# Altium schematic sheet signal-light-6.SchDoc
size A4; SheetNumber: 9; SheetTotal: 21
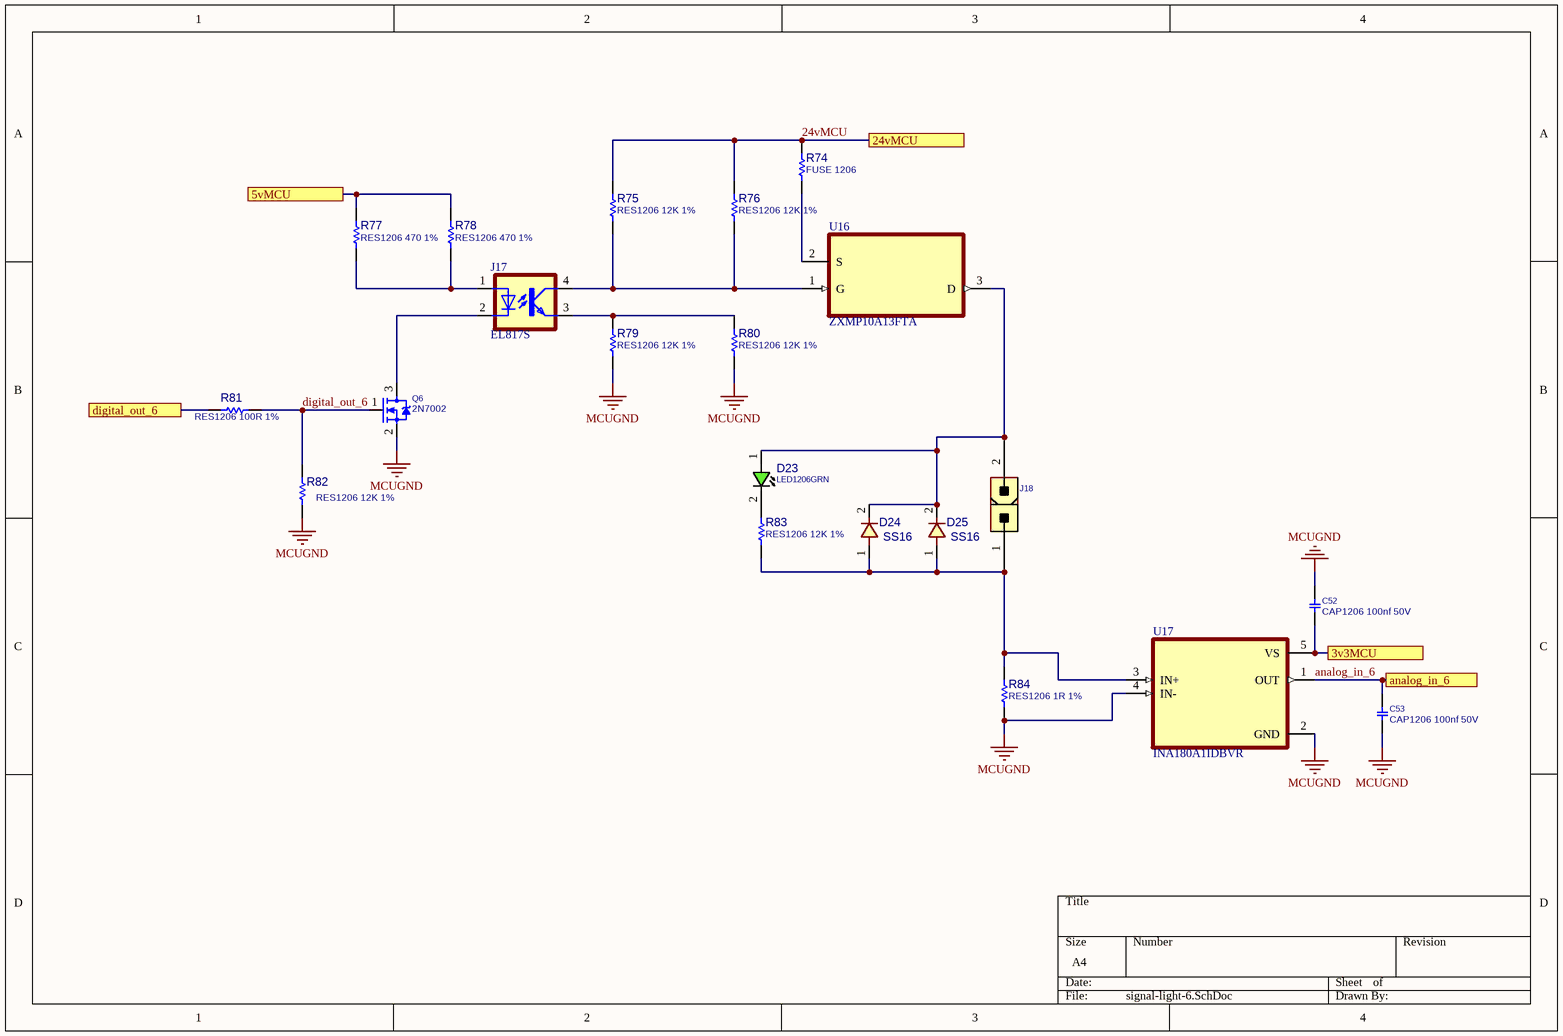
[diagram p0: signal-light-6.SchDoc]

## Parts
C52  CAP1206 100nf 50V  [C1206]
C53  CAP1206 100nf 50V  [C1206]
D23  LED1206GRN  [LED1206GRN]
D24  SS16  [D_SMA]
D25  SS16  [D_SMA]
J17  EL817S  [SOIC254P1030X460-4N]
J18  CONN_ATXPWR_2  [ATXPWR_2]  (value not drawn)
Q6  2N7002  [SOT23_3]
R74  FUSE 1206  [R1206]
R75  RES1206 12K 1%  [R1206]
R76  RES1206 12K 1%  [R1206]
R77  RES1206 470 1%  [R1206]
R78  RES1206 470 1%  [R1206]
R79  RES1206 12K 1%  [R1206]
R80  RES1206 12K 1%  [R1206]
R81  RES1206 100R 1%  [R1206]
R82  RES1206 12K 1%  [R1206]
R83  RES1206 12K 1%  [R1206]
R84  RES1206 1R 1%  [R1206]
U16  ZXMP10A13FTA  [SOT95P230X110-3N]
U17  INA180A1IDBVR  [SOT95P280X145-5N]

## Ports
3v3MCU, 5vMCU, 24vMCU, analog_in_6, digital_out_6

## Nets
MCUGND: C52.1 C53.2 Q6.2(SOURCE) R79.2 R80.2 R82.2 R84.2 U17.2(GND) U17.4(IN-)
3v3MCU: C52.2 U17.5(VS) ; port 3v3MCU
5vMCU: R77.2 R78.2 ; port 5vMCU
24vMCU: R74.1 R75.1 R76.1 ; port 24vMCU
analog_in_6: C53.1 U17.1(OUT) ; port analog_in_6
digital_out_6: Q6.1(GATE) R81.2 R82.1
digital_out_6: R81.1 ; port digital_out_6  [a separate net that carries the same name]
NetD23_1: D23.1(ANODE) D24.2 D25.2 J18.2 U16.3(D)
NetD23_2: D23.2(CATHODE) R83.1
NetD24_1: D24.1 D25.1 J18.1 R83.2 R84.1 U17.3(IN+)
NetJ17_1: J17.1(A) R77.1 R78.1
NetJ17_2: J17.2(C) Q6.3(DRAIN)
NetJ17_3: J17.3(EMIT) R79.1 R80.1
NetJ17_4: J17.4(COL) R75.2 R76.2 U16.1(G)
NetR74_2: R74.2 U16.2(S)

## Library data of the parts
C52 C53 = CAP_SMD_MLCC_1206: CAP, MLCC; PARAM: -, -%; MANF_P#: MANF_PART#; PARAM2: -V; PRICE: 100= 1$; MANF: -; ASSEMBLY: ASSEMBLY
D23 = LED_SMD_1206_GRN: LED, SMD, 1206, GREEN; PARAM: 20mA; DESC: DESCRIPTION; PARAM2: 2.2V; MANF: -; ASSEMBLY: ASSEMBLY; PRICE: 36t@Javan; MANF_P#: -; VALUE: LED1206GRN; MountType: SMT; PartType: LED
D24 D25 = DIODE_SMD_1N4001: DIODE, GENERAL PURPOSE, 50V/1A; DESC: DESCRIPTION; PARAM: 50V VRRM; PARAM2: 1A; MANF_P#: 1N4001; MANF: MANF; ASSEMBLY: ASSEMBLY; PRICE: PRICE; VALUE: SS16
J17 = EL817S: Optoisolator Transistor Output 5000Vrms 1 Channel 4-SMD; MF: Everlight Electronics; SnapEDA_Link: https://www.snapeda.com/parts/EL817S/Everlight+Electronics+Co+Ltd/view-part/?ref=snap; Package: SMD-4 Everlight Electronics Co Ltd; Value: *; MP: EL817S; Check_prices: https://www.snapeda.com/parts/EL817S/Everlight+Electronics+Co+Ltd/view-part/?ref=eda
J18 = CONN_ATXPWR_2: CONN, ATX POWER, 2 P; MANF: Molex; MANF_P#: 39281023; VALUE: CONN_ATXPWR_2; MountType: THD; PACKAGE: ATXPWR-2pin; Part Type: Conn.
Q6 = MOSN_2N7002_SOT23: MOSFET, N-CH, 60V, 0.3A; MANF: NXP; ASSEMBLY: ASSEMBLY; MANF_P#: 2N7002; PARAM2: 60v; PARAM: 0.3A; PRICE: 0.3t@Javan; VALUE: 2N7002
R74-R84 = RES_SMD_1206: RESISTOR, SMD; PARAM: 1%, 0.25W; DESC: DESCRIPTION; DIST#: MOUSER; MANF_P#: -; MANF: -; ASSEMBLY: ASSEMBLY; PRICE: -; PARAM2: -
U16 = ZXMP10A13FTA: P-Channel 100 V 600mA (Ta) 625mW (Ta) Surface Mount SOT-23-3; MF: Diodes Inc.; Purchase-URL: https://pricing.snapeda.com/search/part/ZXMP10A13FTA/?ref=eda; Package: SOT-23-3 Diodes Inc.; SnapEDA_Link: https://www.snapeda.com/parts/ZXMP10A13FTA/Diodes+Inc./view-part/?ref=snap; Availability: In Stock; Value: *; MP: ZXMP10A13FTA; Check_prices: https://www.snapeda.com/parts/ZXMP10A13FTA/Diodes+Inc./view-part/?ref=eda; Price: None
U17 = INA180A1IDBVR: 26V, 350kHz current sense amplifier; MF: Texas Instruments; SnapEDA_Link: https://www.snapeda.com/parts/INA180A1IDBVR/Texas+Instruments/view-part/?ref=snap; Package: SOT-23-5 Texas Instruments; Value: *; MP: INA180A1IDBVR; Check_prices: https://www.snapeda.com/parts/INA180A1IDBVR/Texas+Instruments/view-part/?ref=eda